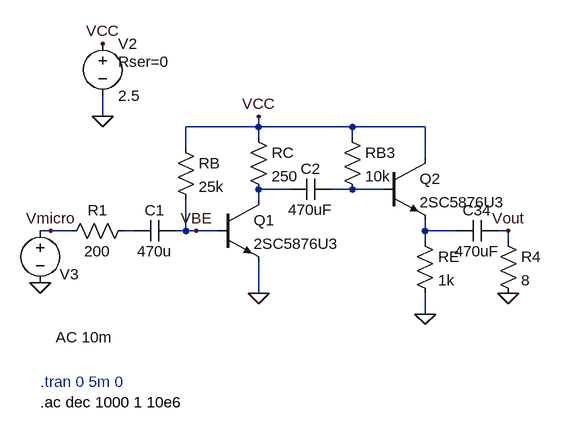
[diagram p0: schematic 3_2.asc]
3_2.asc, the LTspice schematic file:
Version 4.1
SHEET 1 968 680
WIRE 272 -64 272 -96
WIRE 512 -48 512 -64
WIRE 512 -48 400 -48
WIRE 656 -48 512 -48
WIRE 768 -48 656 -48
WIRE 512 -32 512 -48
WIRE 656 -32 656 -48
WIRE 400 -16 400 -48
WIRE 768 0 768 -48
WIRE 560 48 512 48
WIRE 656 48 624 48
WIRE 704 48 656 48
WIRE 512 64 512 48
WIRE 192 112 176 112
WIRE 224 112 192 112
WIRE 320 112 304 112
WIRE 400 112 400 64
WIRE 400 112 384 112
WIRE 416 112 400 112
WIRE 448 112 416 112
WIRE 768 112 768 96
WIRE 816 112 768 112
WIRE 896 112 880 112
WIRE 768 128 768 112
WIRE 896 128 896 112
WIRE 512 208 512 160
WIRE 768 240 768 208
FLAG 272 -64 0
FLAG 272 -176 VCC
FLAG 512 208 0
FLAG 512 -64 VCC
FLAG 176 192 0
FLAG 192 112 Vmicro
FLAG 416 112 VBE
FLAG 768 240 0
FLAG 896 208 0
FLAG 896 112 Vout
SYMBOL npn 448 64 R0
SYMATTR InstName Q1
SYMATTR Value 2SC5876U3
SYMBOL voltage 272 -192 R0
WINDOW 123 0 0 Left 0
WINDOW 39 24 44 Left 2
SYMATTR SpiceLine Rser=0
SYMATTR InstName V2
SYMATTR Value 2.5
SYMBOL res 496 -48 R0
SYMATTR InstName RC
SYMATTR Value 250
SYMBOL voltage 176 96 R0
WINDOW 0 30 83 Left 2
WINDOW 3 24 208 Left 2
WINDOW 123 24 180 Left 2
WINDOW 39 0 0 Left 0
SYMATTR InstName V3
SYMATTR Value ""
SYMATTR Value2 AC 10m
SYMBOL res 320 96 R90
WINDOW 0 0 56 VBottom 2
WINDOW 3 32 56 VTop 2
SYMATTR InstName R1
SYMATTR Value 200
SYMBOL res 384 -32 R0
SYMATTR InstName RB
SYMATTR Value 25k
SYMBOL cap 384 96 R90
WINDOW 0 0 32 VBottom 2
WINDOW 3 32 32 VTop 2
SYMATTR InstName C1
SYMATTR Value 470u
SYMBOL cap 624 32 R90
WINDOW 0 0 32 VBottom 2
WINDOW 3 32 32 VTop 2
SYMATTR InstName C2
SYMATTR Value 470uF
SYMBOL npn 704 0 R0
SYMATTR InstName Q2
SYMATTR Value 2SC5876U3
SYMBOL res 640 -48 R0
SYMATTR InstName RB3
SYMATTR Value 10k
SYMBOL res 752 112 R0
SYMATTR InstName RE
SYMATTR Value 1k
SYMBOL res 880 112 R0
SYMATTR InstName R4
SYMATTR Value 8
SYMBOL cap 880 96 R90
WINDOW 0 0 32 VBottom 2
WINDOW 3 32 32 VTop 2
SYMATTR InstName C34
SYMATTR Value 470uF
TEXT 176 344 Left 2 ;.tran 0 5m 0
TEXT 176 376 Left 2 !.ac dec 1000 1 10e6

The netlist it stands for:
* 3_2.asc
Q1 N001 VBE 0 0 2SC5876U3
V2 VCC 0 2.5 Rser=0
RC VCC N001 250
V3 Vmicro 0 AC 10m
R1 N003 Vmicro 200
RB VCC VBE 25k
C1 VBE N003 470u
C2 N002 N001 470uF
Q2 VCC N002 N004 0 2SC5876U3
RB3 VCC N002 10k
RE N004 0 1k
R4 Vout 0 8
C34 Vout N004 470uF
.model NPN NPN
.model PNP PNP
.lib standard.bjt
* .tran 0 5m 0
.ac dec 1000 1 10e6
.backanno
.end